# Altium project 20_PCB_Project_20.PrjPcb
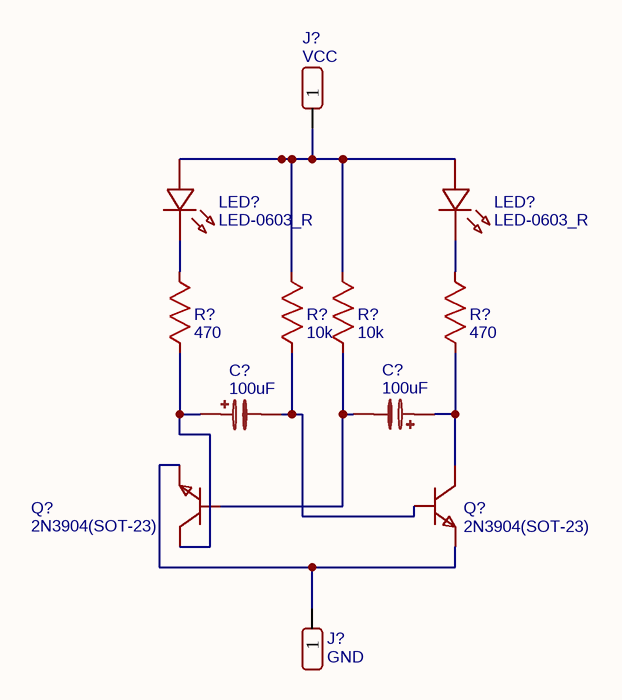
[diagram p0: Sheet1.SchDoc]
1 sheet, 12 parts. Net scope: global (net labels, ports and power ports of the same name join across sheets).
Board file: PCB1.pcbdoc

## Sheet Sheet1.SchDoc
size A; SheetNumber: 1; SheetTotal: 1

### Parts
(Parts that share a designator on the sheet are numbered #1, #2 ... from top to bottom, then left to right.)
C?#1  100uF  [CASE-A_3216]
C?#2  100uF  [CASE-A_3216]
J?#1  VCC  [HDR-M-2.54_1X1]
J?#2  GND  [HDR-M-2.54_1X1]
LED?#1  LED-0603_R  [LED0603_RED]
LED?#2  LED-0603_R  [LED0603_RED]
Q?#1  2N3904(SOT-23)  [SOT-23-3_L2.9-W1.3-P1.90-LS2.4-TR]
Q?#2  2N3904(SOT-23)  [SOT-23-3_L2.9-W1.3-P1.90-LS2.4-TR]
R?#1  470  [R0603]
R?#2  10k  [R0603]
R?#3  10k  [R0603]
R?#4  470  [R0603]

### Nets
NetC?#1_1: C?#1.1 Q?#1.3(C) R?#1.1
NetC?#1_2: C?#1.2 Q?#2.2(B) R?#2.1
NetC?#2_1: C?#2.1 Q?#2.3(C) R?#4.1
NetC?#2_2: C?#2.2 Q?#1.2(B) R?#3.1
NetJ?#1_1: J?#1.1 LED?#1.1 LED?#2.1 R?#2.2 R?#3.2
NetJ?#2_1: J?#2.1 Q?#1.1(E) Q?#2.1(E)
NetLED?#1_2: LED?#1.2 R?#1.2
NetLED?#2_2: LED?#2.2 R?#4.2

### Library data of the parts
C?#1 C?#2 = 100uF: nameAlias: Value(F); Contributor: LCEDA_Lib; spicePre: C; spiceSymbolName: C_Tan_SMD_A_EU
J?#1 = VCC: Contributor: LCEDA_Lib; Supplier Part: C81276; Supplier: LCSC; spicePre: J; spiceSymbolName: HDR-M-2.54_1x1
J?#2 = GND: Contributor: LCEDA_Lib; Supplier Part: C81276; Supplier: LCSC; spicePre: J; spiceSymbolName: HDR-M-2.54_1x1
LED?#1 LED?#2 = LED-0603_R: Manufacturer: EVERLIGHT(台湾亿光); Manufacturer Part: 19-217/R6C-AL1M2VY/3T; Contributor: LCEDA_01; Supplier Part: C72044; Supplier: LCSC; spicePre: L; spiceSymbolName: LED-0603_R
Q?#1 Q?#2 = 2N3904(SOT-23): Manufacturer: KEC; Manufacturer Part: 2n3904S-RTK/PS; Contributor: LCEDA_Lib; Supplier: LCSC; Supplier Part: C18536; Paste Type: SOT-23; spicePre: Q; spiceSymbolName: 2N3904(SOT-23)
R?#1 R?#4 = 470: nameAlias: Value(Ω); Contributor: LCEDA_Lib; spicePre: R; spiceSymbolName: R_0603_US
R?#2 R?#3 = 10k: nameAlias: Value(Ω); Contributor: LCEDA_Lib; spicePre: R; spiceSymbolName: R_0603_US